# Altium project Flex-LED-Board_v2.0.PrjPcb
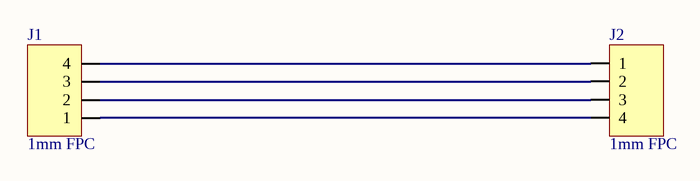
[diagram p0: Flex-LED.SchDoc]
1 sheet, 2 parts. Net scope: global (net labels, ports and power ports of the same name join across sheets).
Board file: PCB_Flex_LED_v2.0.PcbDoc

## Sheet Flex-LED.SchDoc
size A; SheetNumber: 1; SheetTotal: 1

### Parts
J1  1mm FPC  [FPC-1mm-4P - New]
J2  1mm FPC  [FPC-1mm-4P - New]

### Nets
NetJ1_1: J1.1 J2.4
NetJ1_2: J1.2 J2.3
NetJ1_3: J1.3 J2.2
NetJ1_4: J1.4 J2.1

### Library data of the parts
J1 J2 = FPC-1mm-4P-New: 1mm Pitch 4P FPC